# Altium schematic sheet Connectors.SchDoc
size A3; SheetNumber: 7; SheetTotal: 9
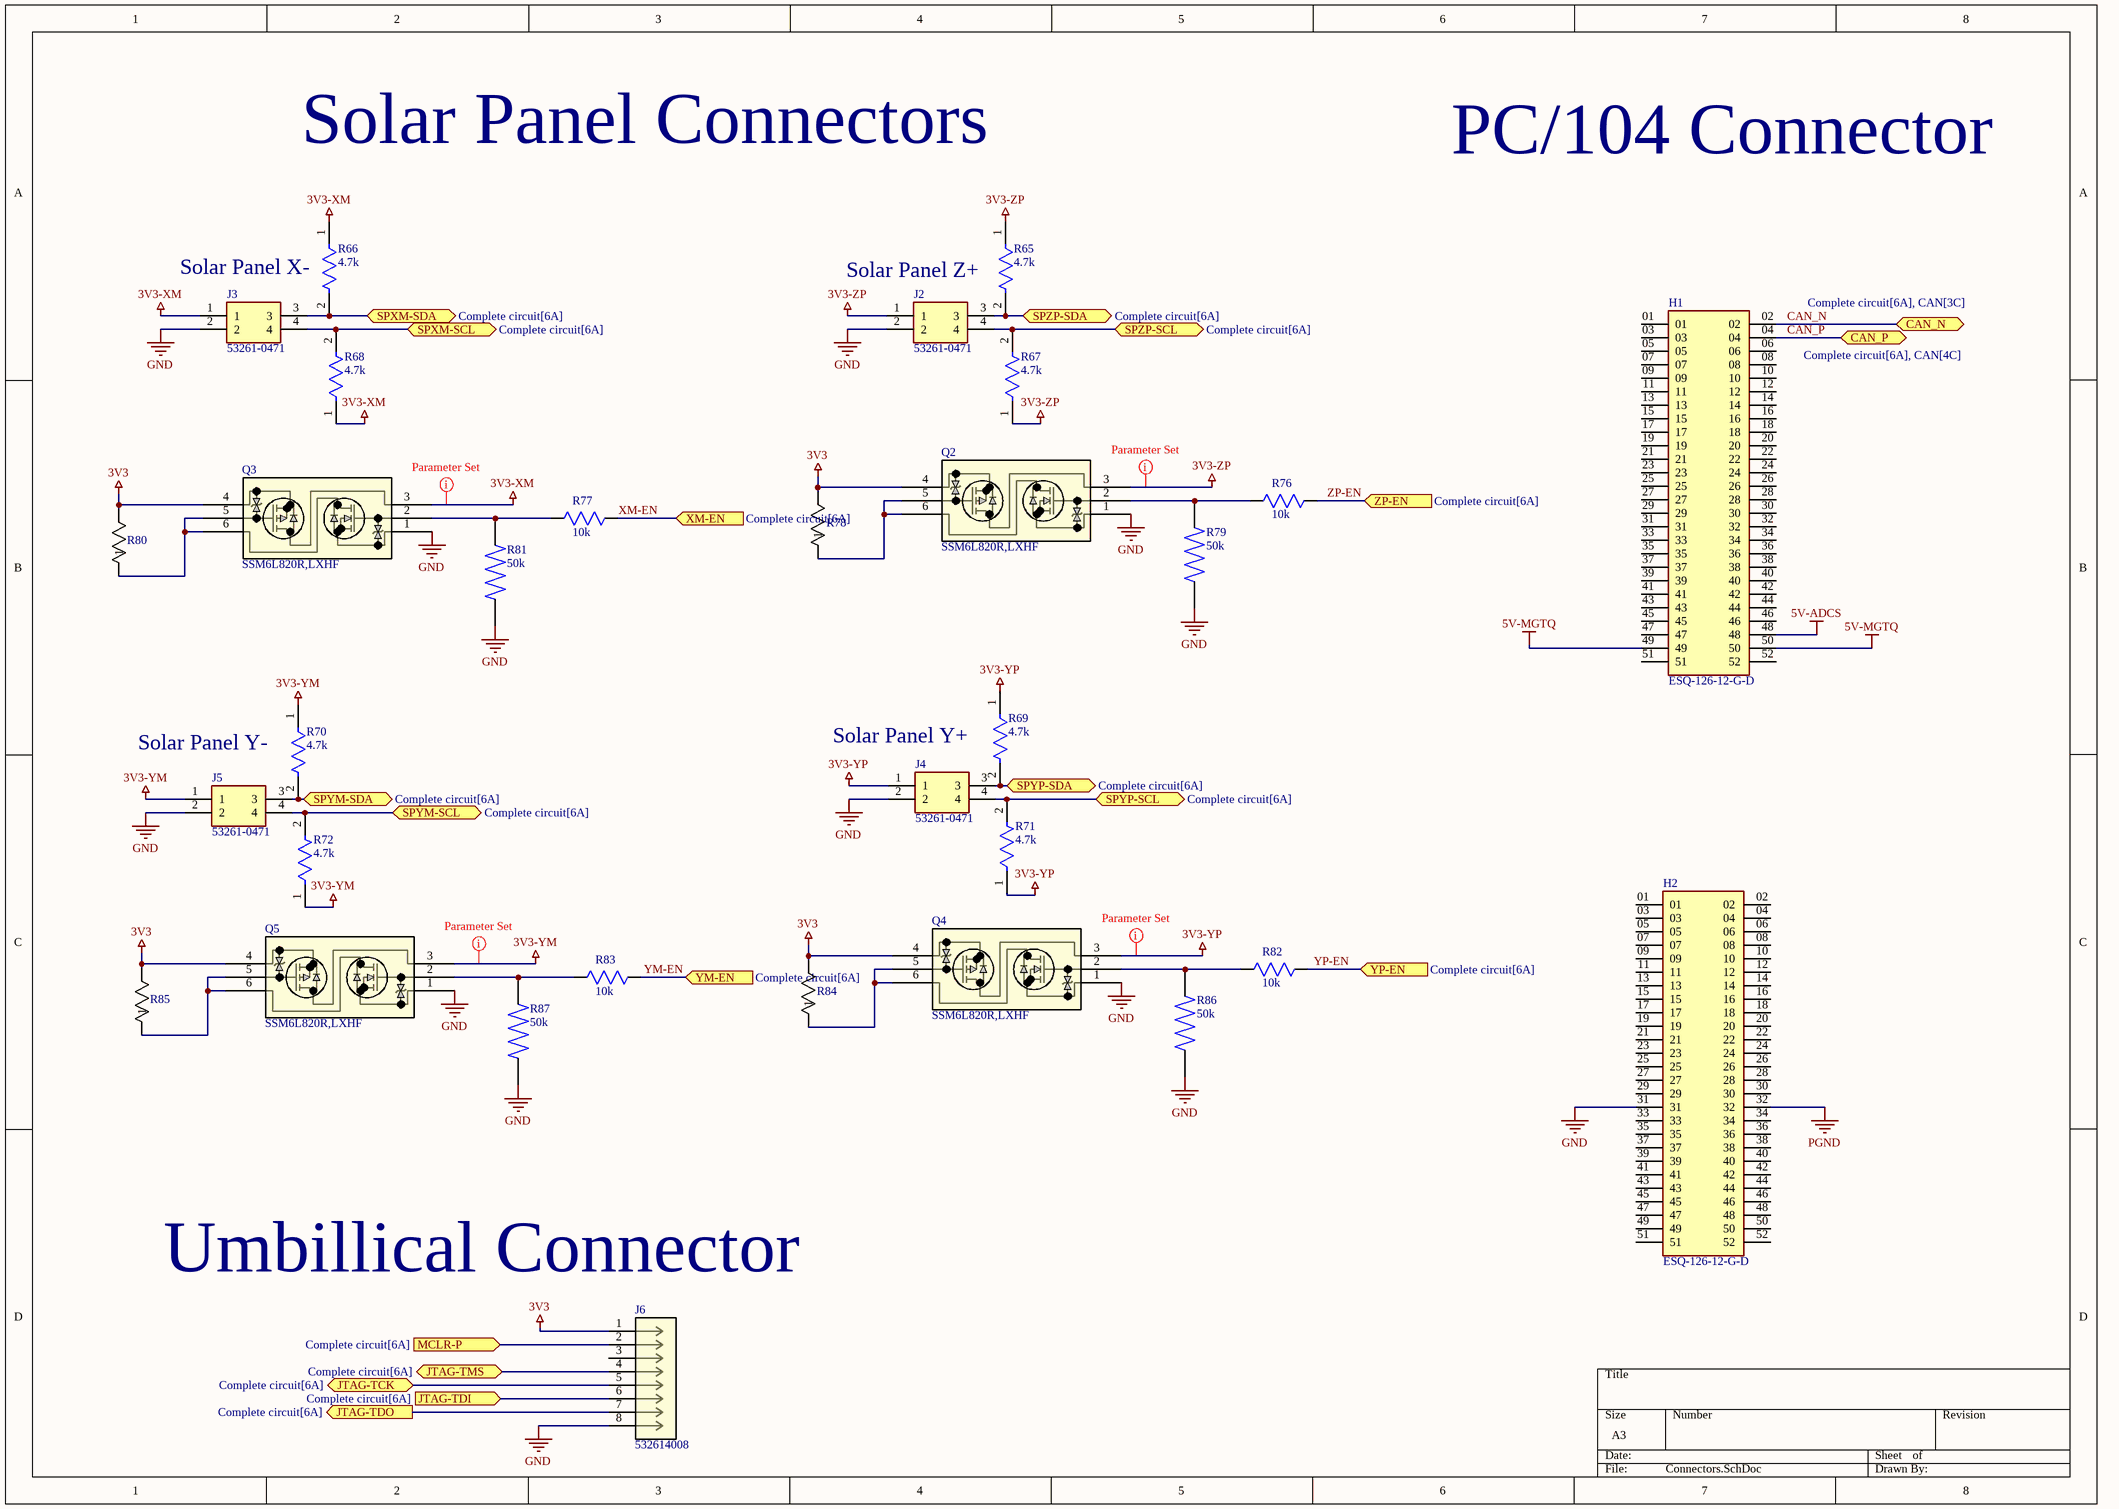
[diagram p0: Connectors.SchDoc]

## Parts
H1  ESQ-126-12-G-D  [SAMTEC_ESQ-126-12-G-D]
H2  ESQ-126-12-G-D  [SAMTEC_ESQ-126-12-G-D]
J2  53261-0471  [53261-0471]
J3  53261-0471  [53261-0471]
J4  53261-0471  [53261-0471]
J5  53261-0471  [53261-0471]
J6  532614008  [CONN_532610000-SD_08_MOL]
Q2  SSM6L820R,LXHF  [TSOP6F_TOS]
Q3  SSM6L820R,LXHF  [TSOP6F_TOS]
Q4  SSM6L820R,LXHF  [TSOP6F_TOS]
Q5  SSM6L820R,LXHF  [TSOP6F_TOS]
R65  value 4.7k  [FP-RG1608-IPC_C]  (hidden comment: RG1608N-472-D-T5)
R66  value 4.7k  [FP-RG1608-IPC_C]  (hidden comment: RG1608N-472-D-T5)
R67  value 4.7k  [FP-RG1608-IPC_C]  (hidden comment: RG1608N-472-D-T5)
R68  value 4.7k  [FP-RG1608-IPC_C]  (hidden comment: RG1608N-472-D-T5)
R69  value 4.7k  [FP-RG1608-IPC_C]  (hidden comment: RG1608N-472-D-T5)
R70  value 4.7k  [FP-RG1608-IPC_C]  (hidden comment: RG1608N-472-D-T5)
R71  value 4.7k  [FP-RG1608-IPC_C]  (hidden comment: RG1608N-472-D-T5)
R72  value 4.7k  [FP-RG1608-IPC_C]  (hidden comment: RG1608N-472-D-T5)
R76  value 10k  [RES_ERA3ARB103V]  (hidden comment: ERA3ARB103V)
R77  value 10k  [RES_ERA3ARB103V]  (hidden comment: ERA3ARB103V)
R78  CRCW060310K0DHEAP  [RC0603N_VIS]  (value not drawn)
R79  value 50k  [RESC1608X55N]  (hidden comment: TNPU060350K0HZEN00)
R80  CRCW060310K0DHEAP  [RC0603N_VIS]  (value not drawn)
R81  value 50k  [RESC1608X55N]  (hidden comment: TNPU060350K0HZEN00)
R82  value 10k  [RES_ERA3ARB103V]  (hidden comment: ERA3ARB103V)
R83  value 10k  [RES_ERA3ARB103V]  (hidden comment: ERA3ARB103V)
R84  CRCW060310K0DHEAP  [RC0603N_VIS]  (value not drawn)
R85  CRCW060310K0DHEAP  [RC0603N_VIS]  (value not drawn)
R86  value 50k  [RESC1608X55N]  (hidden comment: TNPU060350K0HZEN00)
R87  value 50k  [RESC1608X55N]  (hidden comment: TNPU060350K0HZEN00)

## Ports
CAN_N (bidir, see Complete circuit[6A], CAN[3C]), CAN_P (bidir, see Complete circuit[6A], CAN[4C]), JTAG-TCK (bidir, see Complete circuit[6A]), JTAG-TDI (in, see Complete circuit[6A]), JTAG-TDO (out, see Complete circuit[6A]), JTAG-TMS (bidir, see Complete circuit[6A]), MCLR-P (in, see Complete circuit[6A]), SPXM-SCL (bidir, see Complete circuit[6A]), SPXM-SDA (bidir, see Complete circuit[6A]), SPYM-SCL (bidir, see Complete circuit[6A]), SPYM-SDA (bidir, see Complete circuit[6A]), SPYP-SCL (bidir, see Complete circuit[6A]), SPYP-SDA (bidir, see Complete circuit[6A]), SPZP-SCL (bidir, see Complete circuit[6A]), SPZP-SDA (bidir, see Complete circuit[6A]), XM-EN (in, see Complete circuit[6A]), YM-EN (in, see Complete circuit[6A]), YP-EN (in, see Complete circuit[6A]), ZP-EN (in, see Complete circuit[6A])

## Nets
3V3: J6.1 Q2.4 Q3.4 Q4.4 Q5.4 R78.2 R80.2 R84.2 R85.2
3V3-XM: J3.1 Q3.3 R66.1 R68.1
3V3-YM: J5.1 Q5.3 R70.1 R72.1
3V3-YP: J4.1 Q4.3 R69.1 R71.1
3V3-ZP: J2.1 Q2.3 R65.1 R67.1
5V-ADCS: H1.48
5V-MGTQ: H1.49 H1.50
GND: H2.31 J2.2 J3.2 J4.2 J5.2 J6.8 Q2.1 Q3.1 Q4.1 Q5.1 R79.1 R81.1 R86.1 R87.1
PGND: H2.32
CAN_N: H1.02 ; port CAN_N
CAN_P: H1.04 ; port CAN_P
JTAG-TCK: J6.5 ; port JTAG-TCK
JTAG-TDI: J6.6 ; port JTAG-TDI
JTAG-TDO: J6.7 ; port JTAG-TDO
JTAG-TMS: J6.4 ; port JTAG-TMS
MCLR-P: J6.2 ; port MCLR-P
SPXM-SCL: J3.4 R68.2 ; port SPXM-SCL
SPXM-SDA: J3.3 R66.2 ; port SPXM-SDA
SPYM-SCL: J5.4 R72.2 ; port SPYM-SCL
SPYM-SDA: J5.3 R70.2 ; port SPYM-SDA
SPYP-SCL: J4.4 R71.2 ; port SPYP-SCL
SPYP-SDA: J4.3 R69.2 ; port SPYP-SDA
SPZP-SCL: J2.4 R67.2 ; port SPZP-SCL
SPZP-SDA: J2.3 R65.2 ; port SPZP-SDA
XM-EN: R77.2 ; port XM-EN
YM-EN: R83.2 ; port YM-EN
YP-EN: R82.2 ; port YP-EN
ZP-EN: R76.2 ; port ZP-EN
NetQ2_2: Q2.2 R76.1 R79.2
NetQ2_5: Q2.5 Q2.6 R78.1
NetQ3_2: Q3.2 R77.1 R81.2
NetQ3_5: Q3.5 Q3.6 R80.1
NetQ4_2: Q4.2 R82.1 R86.2
NetQ4_5: Q4.5 Q4.6 R84.1
NetQ5_2: Q5.2 R83.1 R87.2
NetQ5_5: Q5.5 Q5.6 R85.1

Not connected (* = marked no-connect by the designer): H1 01 03 05 06 07 08 09 10 11 12 13 14 15 16 17 18 19 20 21 22 23 24 25 26 27 28 29 30 31 32 33 34 35 36 37 38 39 40 41 42 43 44 45 46 47 51 52; H2 01 02 03 04 05 06 07 08 09 10 11 12 13 14 15 16 17 18 19 20 21 22 23 24 25 26 27 28 29 30 33 34 35 36 37 38 39 40 41 42 43 44 45 46 47 48 49 50 51 52; J6 3

## Layout directives
net class SupplyMin: 3V3-XM, 3V3-YM, 3V3-YP, 3V3-ZP

## Notes on the sheet
- Solar Panel Connectors
- PC/104 Connector
- (near R66) Solar Panel X-
- (near R65) Solar Panel Z+
- (near R70) Solar Panel Y-
- (near R69) Solar Panel Y+
- (near J6) Umbillical Connector

## Library data of the parts
H1 H2 = CMP-002-00072-1: Source: ESQ-126-12-G-D.SchLib; Price: None; Case/Package: None; MP: ESQ-126-12-G-D; Value: *; Availability: Unavailable; Pins: 52; Design Item ID: ESQ-126-12-G-D; Component Type: Standard
J2-J5 = 53261-0471: Connector; Manufacturer_Name: Molex; Datasheet Link: http://www.molex.com/webdocs/datasheets/pdf/en-us//0532610471_PCB_HEADERS.pdf; Manufacturer_Part_Number: 53261-0471; Mouser Part Number: 538-53261-0471; Mouser Price/Stock: https://www.mouser.co.uk/ProductDetail/Molex/53261-0471?qs=%252B72YyncTwW9e3et3PwnEMw%3D%3D; Arrow Part Number: 53261-0471; Arrow Price/Stock: null?region=nac
J6 = CMP-002-00084-1: 1.25mm Pitch, PicoBlade PCB Header, Single Row, Right-Angle, Surface Mount, Gold (Au) Flash Plating, Friction Lock, 8 Circuits, Natural, Tape and Reel; Manufacturer_Name: Molex Connector Corporation; Manufacturer_Part_Number: 532614008; RefDes: RefDes; Design Item ID: 532614008; Copyright: Copyright (C) 2026 Ultra Librarian. All rights reserved.; Type: Type; Source: 532614008.SchLib
Q2-Q5 = CMP-382-000000-1: N-ch + P-ch MOSFET, 30 V/-20 V, 4 A/-4 A, 0.0391 Î©@4.5V/0.045 Î©@10V, TSOP6F; Manufacturer_Name: Toshiba Electronic Devices & Storage Corp.; Datasheet: https://toshiba.semicon-storage.com/info/docget.jsp?did=63678&prodName=SSM6L820R; Type: Type; Design Item ID: SSM6L820R,LXHF; Copyright: Copyright (C) 2026 Ultra Librarian. All rights reserved.; RefDes: RefDes; Manufacturer_Part_Number: SSM6L820R,LXHF; Source: SSM6L820R,LXHF.SchLib
R65-R72 = CMP-009-00179-2: Fixed Resistor, Thin Film, 0.1W, 4700ohm, 100V, 0.5% +/-Tol, 10ppm/Cel, Surface Mount, 0603; Additional Feature: ANTI-SULFUR, PRECISION; Package Height: 0.4mm; Temperature Coefficient (ppm/Cel): 10; Reference Standard: AEC-Q200; Package Length: 1.6mm; Rated Temperature: 70°C; Package Width: 0.8mm; Power: 166.7mW; Mounting Technology: Surface Mount; JESD-609 Code: e3; Packaging: Tape and Reel; Min Operating Temperature: -55°C; Working Voltage: 100V; Reach SVHC Compliant: Yes; Construction: Rectangular; RoHS Compliant: Yes; Termination: Wraparound; Pins: 2; Resistor Type: FIXED RESISTOR; Tolerance: 0.5%; Max Operating Temperature: 155°C; Terminal Finish: Tin; Case/Package: 0603; Technology: THIN FILM
R76 R77 R82 R83 = CMP-009-00245-3: Thin Film Resistors - SMD 0603 10Kohm 0.1% 10ppm AEC-Q200; Design Item ID: ERA3ARB103V; Case/Package: None; Pins: 2; Source: ERA3ARB103V.SchLib; Component Type: Standard; MP: ERA3ARB103V; Availability: Unavailable; Price: None
R78 R80 R84 R85 = CMP-009-00226-2: D11/CRCW0603-P 50 10K 0.5% ET1 e3; Manufacturer_Name: Vishay; Manufacturer_Part_Number: CRCW060310K0DHEAP; Copyright: Copyright (C) 2026 Ultra Librarian. All rights reserved.; Datasheet: https://www.vishay.com/doc?20036; Design Item ID: CRCW060310K0DHEAP; Source: CRCW060310K0DHEAP.SchLib
R79 R81 R86 R87 = CMP-009-00220-1: 50 kOhms Â±0.02% 0.1W, 1/10W Chip Resistor 0603 (1608 Metric) Anti-Sulfur, Automotive AEC-Q200, Moisture Resistant Thin Film; MF: Vishay; Check_prices: https://www.snapeda.com/parts/TNPU060350K0HZEN00/Vishay/view-part/?ref=eda; SnapEDA_Link: https://www.snapeda.com/parts/TNPU060350K0HZEN00/Vishay/view-part/?ref=snap; Component Type: Standard; Design Item ID: TNPU060350K0HZEN00; Source: TNPU060350K0HZEN00.SchLib; MP: TNPU060350K0HZEN00; Case/Package: 1608 Vishay; Pins: 2